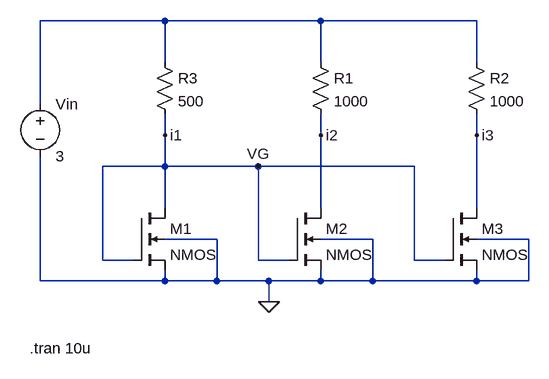
[diagram p0: schematic CurrentMirrors.asc]
CurrentMirrors.asc, the LTspice schematic file:
Version 4
SHEET 1 820 488
WIRE 256 -32 64 -32
WIRE 496 -32 256 -32
WIRE 736 -32 496 -32
WIRE 256 32 256 -32
WIRE 496 32 496 -32
WIRE 736 32 736 -32
WIRE 64 96 64 -32
WIRE 256 144 256 112
WIRE 496 144 496 112
WIRE 736 144 736 112
WIRE 256 192 256 144
WIRE 256 192 160 192
WIRE 400 192 256 192
WIRE 640 192 400 192
WIRE 256 256 256 192
WIRE 496 256 496 144
WIRE 736 256 736 144
WIRE 336 304 256 304
WIRE 576 304 496 304
WIRE 816 304 736 304
WIRE 160 336 160 192
WIRE 208 336 160 336
WIRE 400 336 400 192
WIRE 448 336 400 336
WIRE 640 336 640 192
WIRE 688 336 640 336
WIRE 64 368 64 176
WIRE 256 368 256 352
WIRE 256 368 64 368
WIRE 336 368 336 304
WIRE 336 368 256 368
WIRE 416 368 336 368
WIRE 496 368 496 352
WIRE 496 368 416 368
WIRE 576 368 576 304
WIRE 576 368 496 368
WIRE 736 368 736 352
WIRE 736 368 576 368
WIRE 816 368 816 304
WIRE 816 368 736 368
WIRE 416 400 416 368
FLAG 416 400 0
FLAG 400 192 VG
FLAG 256 144 i1
FLAG 496 144 i2
FLAG 736 144 i3
SYMBOL Voltage 64 80 R0
SYMATTR InstName Vin
SYMATTR Value 3
SYMBOL nmos4 208 256 R0
SYMATTR InstName M1
SYMATTR Value2 l=80nm w=200nm
SYMBOL nmos4 448 256 R0
SYMATTR InstName M2
SYMATTR Value2 l=80nm w=200nm
SYMBOL nmos4 688 256 R0
SYMATTR InstName M3
SYMATTR Value2 l=80nm w=200nm
SYMBOL Res 480 16 R0
SYMATTR InstName R1
SYMATTR Value 1000
SYMBOL Res 720 16 R0
SYMATTR InstName R2
SYMATTR Value 1000
SYMBOL Res 240 16 R0
SYMATTR InstName R3
SYMATTR Value 500
TEXT 48 472 Left 2 !.tran 10u

The netlist it stands for:
* CurrentMirrors.asc
Vin N001 0 3
M1 i1 i1 0 0 NMOS l=80nm w=200nm
M2 i2 i1 0 0 NMOS l=80nm w=200nm
M3 i3 i1 0 0 NMOS l=80nm w=200nm
R1 N001 i2 1000
R2 N001 i3 1000
R3 N001 i1 500
.model NMOS NMOS
.model PMOS PMOS
.lib standard.mos
.tran 10u
.backanno
.end